# Altium schematic sheet IQ_DEMOD.SchDoc
size A; SheetNumber: 6; SheetTotal: 12
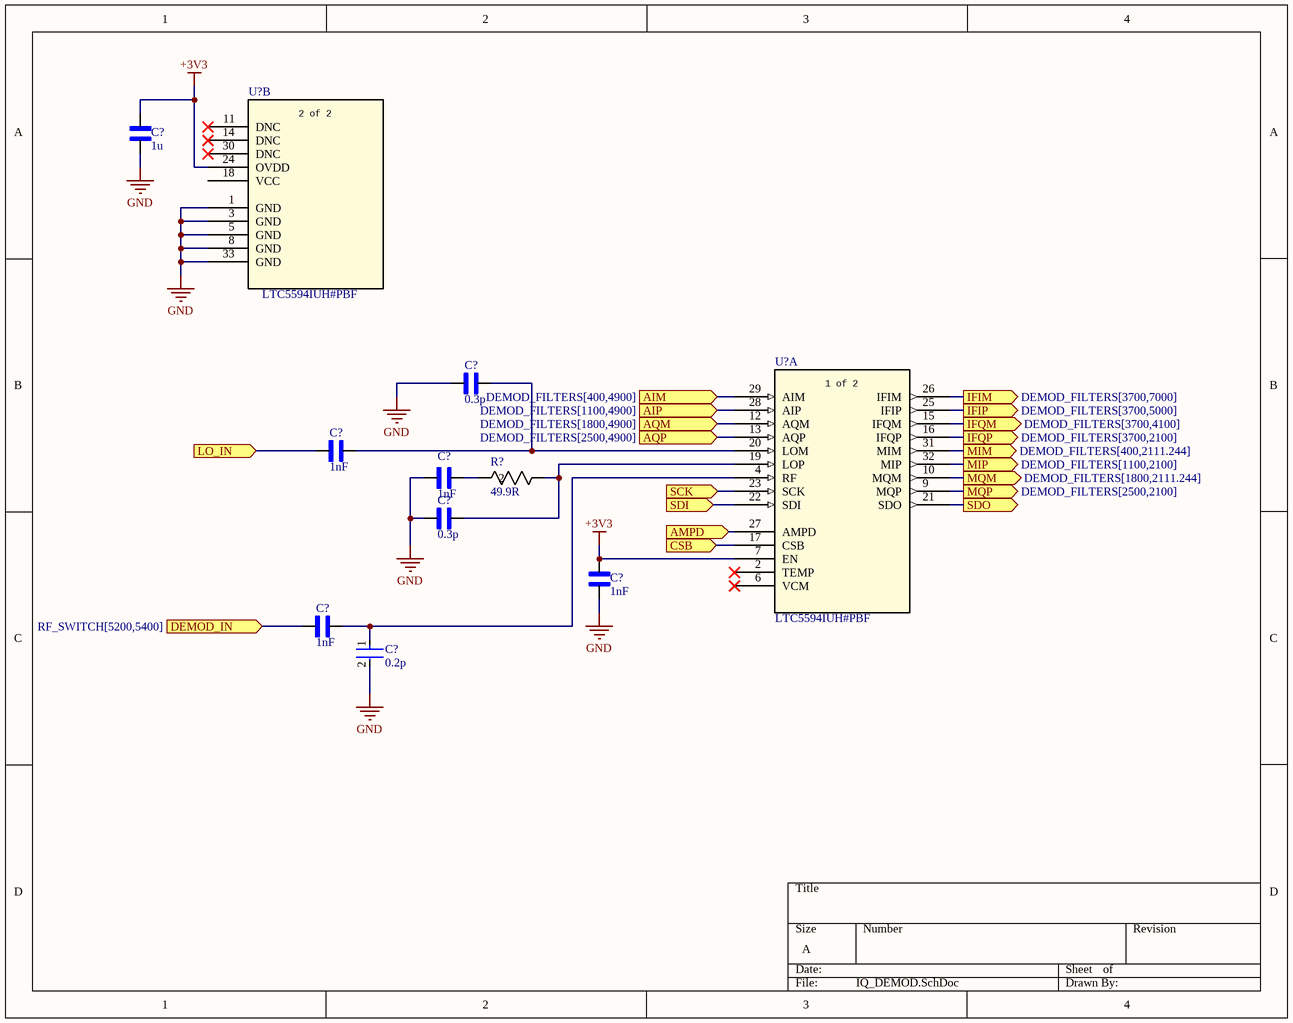
[diagram p0: IQ_DEMOD.SchDoc]

## Parts
(Parts that share a designator on the sheet are numbered #1, #2 ... from top to bottom, then left to right.)
C?#1  1u  [CAPC1608X90N]
C?#2  0.3p  [CAPC1005X55N]
C?#3  1nF  [CAPC1005X55N]
C?#4  1nF  [CAPC1005X55N]
C?#5  0.3p  [CAPC1005X55N]
C?#6  1nF  [CAPC1005X55N]
C?#7  1nF  [CAPC1005X55N]
C?#8  0.2p  [FP-GJM155-0_05-IPC_A]
R?  49.9R  [RC0402N_YAG]
U?#1  LTC5594IUH#PBF  [UH_05-08-1693_ADI]  (part B of 2)
U?#2  LTC5594IUH#PBF  [UH_05-08-1693_ADI]  (part A of 2)

## Ports
AIM (in, see DEMOD_FILTERS[400,4900]), AIP (in, see DEMOD_FILTERS[1100,4900]), AMPD (in), AQM (in, see DEMOD_FILTERS[1800,4900]), AQP (in, see DEMOD_FILTERS[2500,4900]), CSB (in), DEMOD_IN (in, see RF_SWITCH[5200,5400]), IFIM (out, see DEMOD_FILTERS[3700,7000]), IFIP (out, see DEMOD_FILTERS[3700,5000]), IFQM (out, see DEMOD_FILTERS[3700,4100]), IFQP (out, see DEMOD_FILTERS[3700,2100]), LO_IN (in), MIM (out, see DEMOD_FILTERS[400,2111.244]), MIP (out, see DEMOD_FILTERS[1100,2100]), MQM (out, see DEMOD_FILTERS[1800,2111.244]), MQP (out, see DEMOD_FILTERS[2500,2100]), SCK (in), SDI (in), SDO (out)

## Nets
+3V3: C?#1.2 C?#6.2 U?#1.24(OVDD) U?#2.7(EN)
GND: C?#1.1 C?#2.1 C?#4.1 C?#5.1 C?#6.1 C?#8.2 U?#1.1(GND) U?#1.3(GND) U?#1.5(GND) U?#1.8(GND) U?#1.33(GND)
AIM: U?#2.29(AIM) ; port AIM
AIP: U?#2.28(AIP) ; port AIP
AMPD: U?#2.27(AMPD) ; port AMPD
AQM: U?#2.12(AQM) ; port AQM
AQP: U?#2.13(AQP) ; port AQP
CSB: U?#2.17(CSB) ; port CSB
DEMOD_IN: C?#7.1 ; port DEMOD_IN
IFIM: U?#2.26(IFIM) ; port IFIM
IFIP: U?#2.25(IFIP) ; port IFIP
IFQM: U?#2.15(IFQM) ; port IFQM
IFQP: U?#2.16(IFQP) ; port IFQP
LO_IN: C?#3.1 ; port LO_IN
MIM: U?#2.31(MIM) ; port MIM
MIP: U?#2.32(MIP) ; port MIP
MQM: U?#2.10(MQM) ; port MQM
MQP: U?#2.9(MQP) ; port MQP
SCK: U?#2.23(SCK) ; port SCK
SDI: U?#2.22(SDI) ; port SDI
SDO: U?#2.21(SDO) ; port SDO
NetC?#2_2: C?#2.2 C?#3.2 U?#2.20(LOM)
NetC?#4_2: C?#4.2 R?.2
NetC?#5_2: C?#5.2 R?.1 U?#2.19(LOP)
NetC?#7_2: C?#7.2 C?#8.1 U?#2.4(RF)

Not connected (* = marked no-connect by the designer): U?#1 11(DNC)* 14(DNC)* 18(VCC) 30(DNC)*; U?#2 2(TEMP)* 6(VCM)*

## Notes on the sheet
- (in symbol LTC5594IUHPBF, part A) 1 of 2
- (in symbol LTC5594IUHPBF, part B) 2 of 2

## Library data of the parts
C?#1 = GCM188R71E105KA64J-1u: 1 ÂµF Â±10% 25V Ceramic Capacitor X7R 0603 (1608 Metric); MF: Murata; SnapEDA_Link: https://www.snapeda.com/parts/GCM188R71E105KA64J/Murata/view-part/?ref=snap; Package: 1608-2 MURATA; Value: *; MP: GCM188R71E105KA64J; Check_prices: https://www.snapeda.com/parts/GCM188R71E105KA64J/Murata/view-part/?ref=eda
C?#2 C?#5 = GJM1555C1HR30WB01D-0.3p: 0402 0.3 pF 50V Â±0.05 pF Tolerance C0G SMT Multilayer Ceramic Capacitor; MF: Murata; SnapEDA_Link: https://www.snapeda.com/parts/GJM1555C1HR30WB01D/Murata/view-part/?ref=snap; Package: 1005 Taiyo Yuden; Value: *; MP: GJM1555C1HR30WB01D; Check_prices: https://www.snapeda.com/parts/GJM1555C1HR30WB01D/Murata/view-part/?ref=eda
C?#3 C?#4 C?#6 C?#7 = GRM1555C1H102FA01D-1n: SMD capacitor C0G(EIA) with capacitance 1000pF Tol.1%. Rated voltage 50Vdc 125C; MF: Murata; SnapEDA_Link: https://www.snapeda.com/parts/GRM1555C1H102FA01D/Murata/view-part/?ref=snap; Package: 1005-2 Murata; Value: *; MP: GRM1555C1H102FA01D; Check_prices: https://www.snapeda.com/parts/GRM1555C1H102FA01D/Murata/view-part/?ref=eda
C?#8 = CMP-2008-03898-2-0.2p: Multi-Layer Ceramic Capacitor 0.2pF C0G  ±0.1pF 0402 Paper T/R; Voltage Rating (DC): 50V; Packaging: Tape and Reel; REACH SVHC: No SVHC; Mount: Surface Mount; Thickness: 0.022inch; Height: 0.5mm; Package Quantity: 1; Depth: 0.5mm; Max Operating Temperature: 125°C; Case Code (Imperial): 0402; Number of Pins: 2; Termination: SMD/SMT; Min Operating Temperature: -55°C; Lead Pitch: 0.3mm; Width: 0.5mm; Radiation Hardening: No; Length: 1mm; Voltage Rating: 50V; Dielectric: C0G; Case/Package: 0402; Capacitance: 0.2pF; Lead Free: Lead Free; Case Code (Metric): 1005
R? = RC0402FR-0749R9L-49.9R: RES, 49.9, 1%, 0.063 W, 0402; Manufacturer_Name: Yageo; Copyright: Copyright (C) 2025 Ultra Librarian. All rights reserved.; Manufacturer_Part_Number: RC0402FR-0749R9L
U?#1 U?#2 = LTC5594IUHPBF: 300MHz to 9GHz High Linearity I/Q Demodulator with Wideband IF Amplifier; Manufacturer_Name: Analog Devices Inc; Copyright: Copyright (C) 2026 Ultra Librarian. All rights reserved.; Manufacturer_Part_Number: LTC5594IUH#PBF; RefDes: RefDes; Type: Type